# EAGLE design LiPo-BoardV1-2019 (EAGLE 9.2.2)
ERSTELLER: Jakob Holz; PROJEKT: LiPo-Baord; VERSION: 1.0
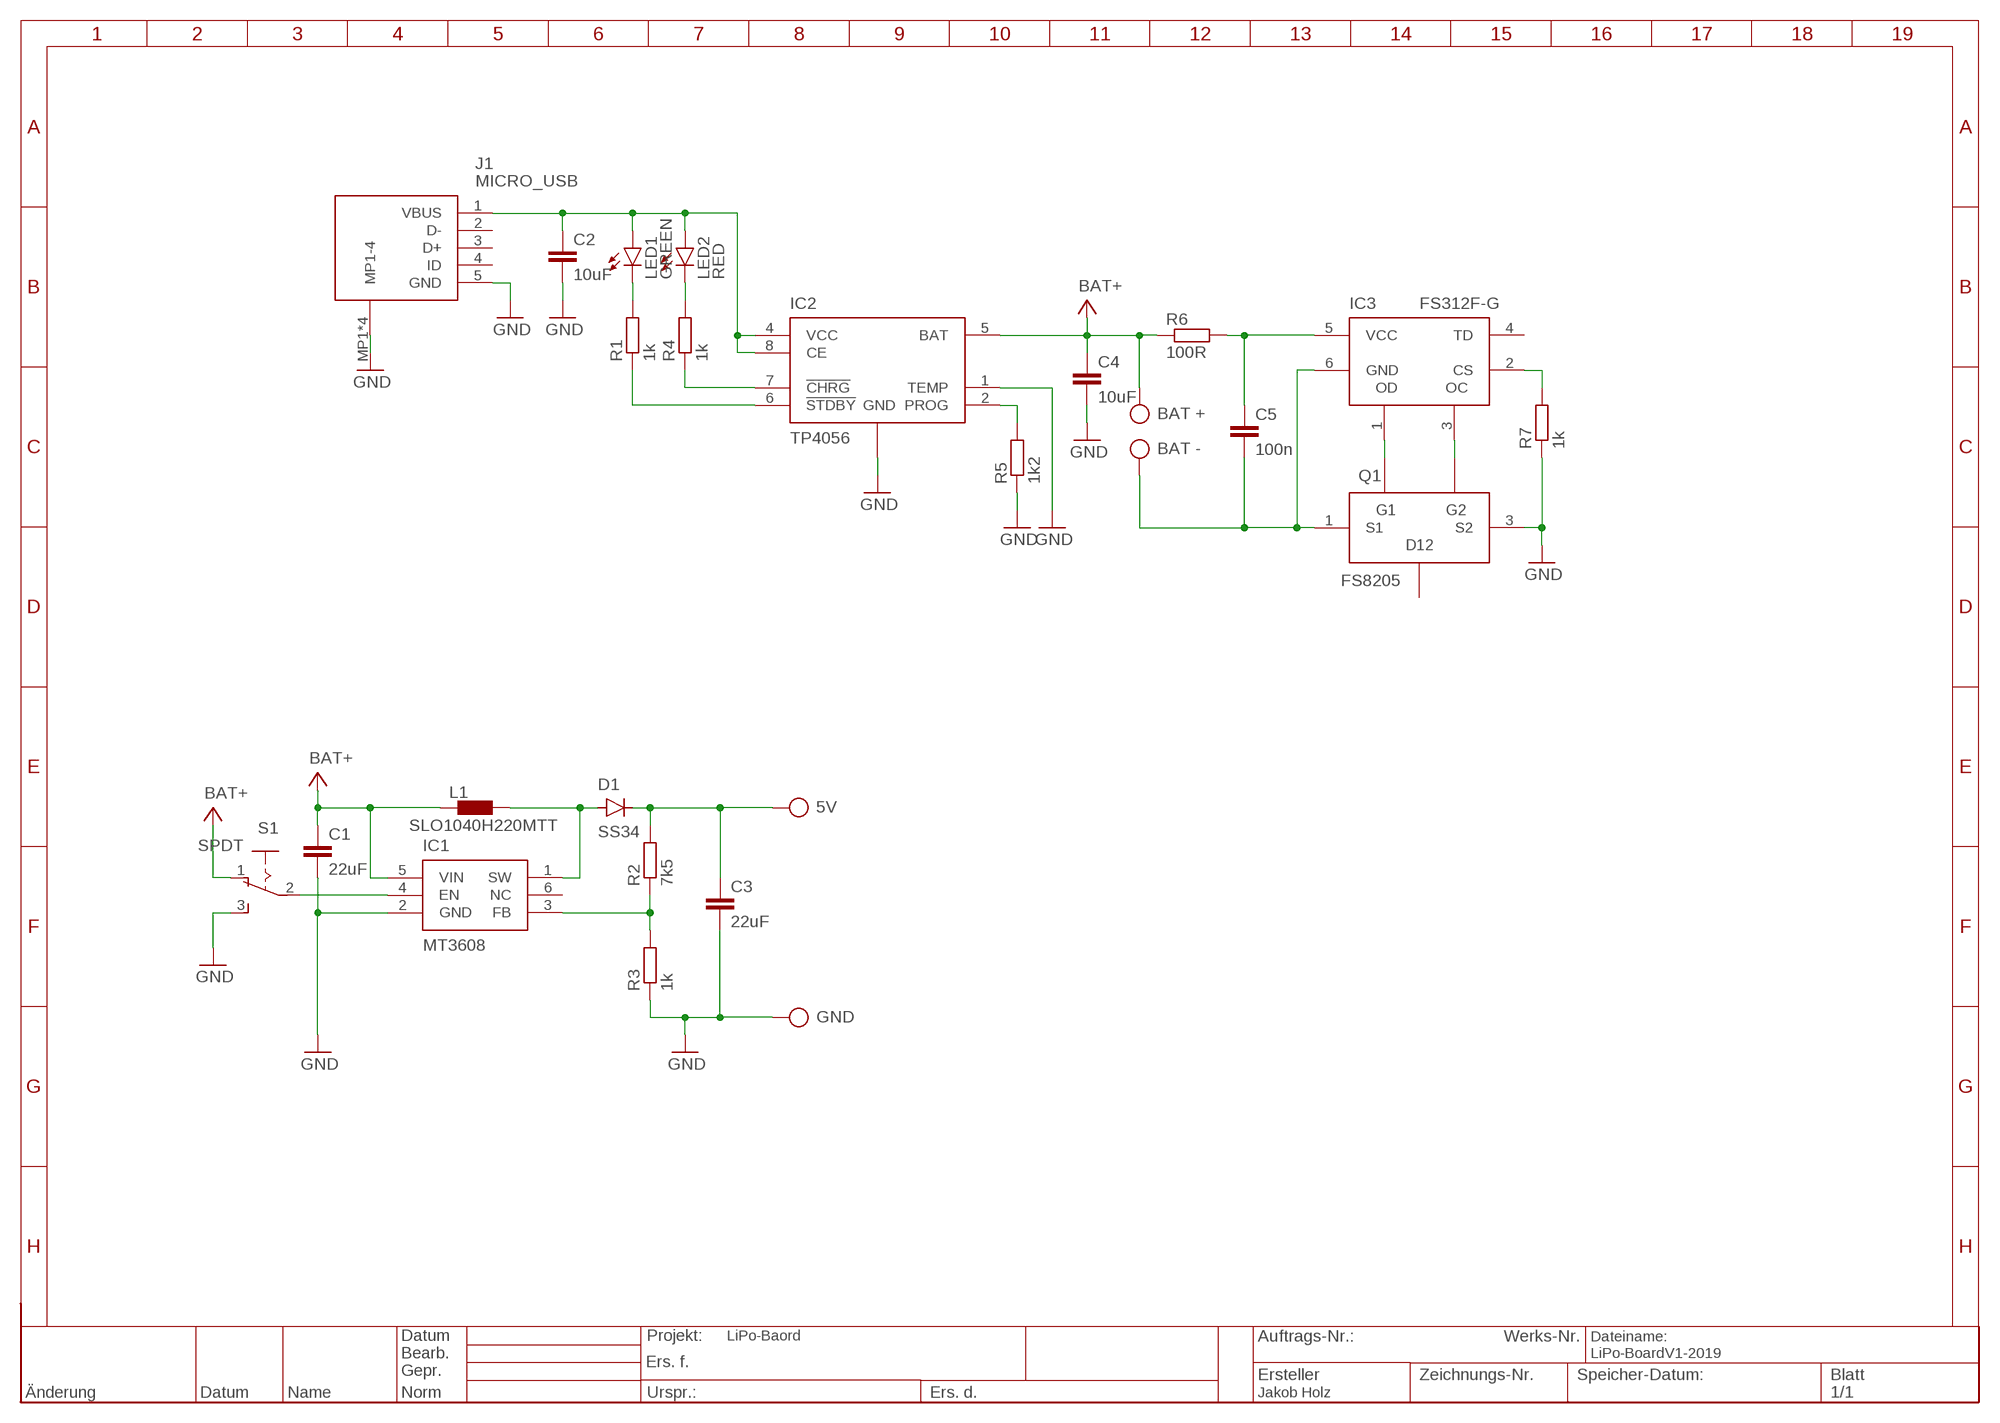
[diagram p0: schematic, sheet 1]

## Parts
C1  22uF  C-EUC1812  [C1812]
C2  10uF  C-EUC0603  [C0603]
C3  22uF  C-EUC1812  [C1812]
C4  10uF  C-EUC0603  [C0603]
C5  100n  C-EUC0603  [C0603]
D1  SS34  DIODE-DO-214AC  [DO-214AC]
IC1  MT3608  [SOT-23-6]
IC2  TP4056  [SOP-8]
IC3  FS312F-G  [SOT-23-6]
J1  MICRO_USB  [MICROUSB]
J2  5V  CON-PAD  [CON-PAD]
J3  GND  CON-PAD  [CON-PAD]
J4  BAT +  CON-PAD  [CON-PAD]
J5  BAT -  CON-PAD  [CON-PAD]
L1  SLO1040H220MTT  [INDUCTOR10.8X10]
LED1  GREEN  LEDCHIPLED_0603  [CHIPLED_0603]
LED2  RED  LEDCHIPLED_0603  [CHIPLED_0603]
Q1  FS8205  [SOT-23-6]
R1  1k  R-EU_R0603  [R0603]
R2  7k5  R-EU_R0603  [R0603]
R3  1k  R-EU_R0603  [R0603]
R4  1k  R-EU_R0603  [R0603]
R5  1k2  R-EU_R0603  [R0603]
R6  100R  R-EU_R0603  [R0603]
R7  1k  R-EU_R0603  [R0603]
S1  SPDT  [SPDT]

## Nets
5V: C3.1 D1.C J2.1 R2.2
BAT+: C1.1 C4.1 IC1.5(VIN) IC2.5(BAT) J4.1 L1.1 R6.1 S1.1
BAT-: C5.2 IC3.6(GND) J5.1 Q1.1(S1)
GND: C1.2 C2.2 C3.2 C4.2 IC1.2(GND) IC2.1(TEMP) IC2.3(GND) IC2.9(GND) J1.5(GND) J1.MP1(MP1-4) J1.MP2(MP1-4) J1.MP3(MP1-4) J1.MP4(MP1-4) J3.1 Q1.3(S2) R3.1 R5.1 R7.1 S1.3
N$1: D1.A IC1.1(SW) L1.2
N$2: LED1.C R1.2
N$3: LED2.C R4.2
N$4: IC2.7(!CHRG) R4.1
N$5: IC2.6(!STDBY) R1.1
N$6: IC1.3(FB) R2.1 R3.2
N$7: IC2.2(PROG) R5.2
N$8: IC1.4(EN) S1.2
N$10: IC3.1(OD) Q1.6(G1)
N$11: IC3.3(OC) Q1.4(G2)
N$12: IC3.2(CS) R7.2
N$13: C5.1 IC3.5(VCC) R6.2
VBUS: C2.1 IC2.4(VCC) IC2.8(CE) J1.1(VBUS) LED1.A LED2.A
Unconnected: IC1.6(NC) IC3.4(TD) J1.2(D-) J1.3(D+) J1.4(ID) Q1.2(D12) Q1.5(D12)

## Library data of the parts
C1 C3 = resistor:C-EU: CAPACITOR, European symbol
C2 C4 C5 = rcl:C-EU: CAPACITOR, European symbol; SPICEPREFIX: C
D1 = diode:DIODE-: DIODE
IC1 = Jakobs_LBR:MT3608: High Efficiency 1.2MHz 2A Step Up Converter Source: Datasheet <https://www.olimex.com/Products/Breadboarding/BB-PWR-3608/resources/MT3608.pdf>; DESCRIPTION: High Efficiency 1.2MHz 2A Step Up Converter; HEIGHT: 1.45mm; MANUFACTURER_NAME: Aerosemi; MANUFACTURER_PART_NUMBER: MT3608
IC2 = Jakobs_LBR:TP4056: 1A Standalone Linear Li-lon Battery Charger, SOP-8 Source: Datasheet <https://dlnmh9ip6v2uc.cloudfront.net/datasheets/Prototyping/TP4056.pdf>; DESCRIPTION: 1A Standalone Linear Li-lon Battery Charger, SOP-8; HEIGHT: 1.75mm; MANUFACTURER_NAME: NanJing Top Power; MANUFACTURER_PART_NUMBER: TP4056
IC3 = Jakobs_LBR:FS312F-G: One Cell Lithium-ion/Polymer Battery Protection IC Source: Datasheet <https://www.ic-fortune.com/upload/Download/FS312F-G-DS-12_EN.pdf>; DESCRIPTION: One Cell Lithium-ion/Polymer Battery Protection IC; HEIGHT: 1.45mm; MANUFACTURER_NAME: Fortune Semiconductor Corporation; MANUFACTURER_PART_NUMBER: FS312F-G
J1 = Jakobs_LBR:MICRO_USB
J2-J5 = Jakobs_LBR:CON-PAD
L1 = Jakobs_LBR:SLO1040H220MTT; DC_CURRENT: 4A; DC_RESISTANCE: 66mΩ; INDUCTANCE: 22uH; SATURATION_CURRENT: 5.5A
LED1 LED2 = led:LED: LED OSRAM: - CHIPLED LG R971, LG N971, LY N971, LG Q971, LY Q971, LO R971, LY R971 LH N974, LH R974 LS Q976, LO Q976, LY Q976 LO Q996 - Hyper CHIPLED LW Q18S LB Q993, LB Q99A, LB R99A - SideLED LS A670, LO A670, LY A670, LG A670, LP A670 LB A673, LV A673, LT A673, LW A673 LH A674 LY A675 LS A676, LA A676, LO A676, LY A676, LW A676 LS A679, LY A679, LG A679 - Hyper Micro SIDELED® LS Y876, LA Y876, LO Y876, LY Y876 LT Y87S - SmartLED LW L88C, LW L88S LB L89C, LB L89S, LG L890 LS L89K, LO L89K, LY L89K LS L896, LA L896, LO L896, LY L896 - TOPLED LS T670, LO T670, LY T670, LG T670, LP T670 LSG T670, LSP T670, LSY T670, LOP T670, LYG T670 LG T671, LOG T671, LSG T671 LB T673, LV T673, LT T673, LW T673 LH T674 LS T676, LA T676, LO T676, LY T676, LB T676, LH T676, LSB T676, LW T676 LB T67C, LV T67C, LT T67C, LS T67K, LO T67K, LY T67K, LW E67C LS E67B, LA E67B, LO E67B, LY E67B, LB E67C, LV E67C, LT E67C LW T67C LS T679, LY T679, LG T679 LS T770, LO T770, LY T770, LG T770, LP T770 LB T773, LV T773, LT T773, LW T773 LH T774 LS E675, LA E675, LY E675, LS T675 LS T776, LA T776, LO T776, LY T776, LB T776 LHGB T686 LT T68C, LB T68C - Hyper Mini TOPLED® LB M676 - Mini TOPLED Santana® LG M470 LS M47K, LO M47K, LY M47K Source: http://www.osram.convergy.de LUXEON: - LUMILED® LXK2-PW12-R00, LXK2-PW12-S00, LXK2-PW14-U00, LXK2-PW14-V00 LXK2-PM12-R00, LXK2-PM12-S00, LXK2-PM14-U00 LXK2-PE12-Q00, LXK2-PE12-R00, LXK2-PE12-S00, LXK2-PE14-T00, LXK2-PE14-U00 LXK2-PB12-K00, LXK2-PB12-L00, LXK2-PB12-M00, LXK2-PB14-N00, LXK2-PB14-P00, LXK2-PB14-Q00 LXK2-PR12-L00, LXK2-PR12-M00, LXK2-PR14-Q00, LXK2-PR14-R00 LXK2-PD12-Q00, LXK2-PD12-R00, LXK2-PD12-S00 LXK2-PH12-R00, LXK2-PH12-S00 LXK2-PL12-P00, LXK2-PL12-Q00, LXK2-PL12-R00 Source: www.luxeon.com KINGBRIGHT: KA-3528ASYC Source: www.kingbright.com
Q1 = Jakobs_LBR:FS8205: DUAL N-CHANNEL ENHANCEMENT MODE POWER MOFSET Source: Datasheet <https://www.ic-fortune.com/upload/Download/FS8205-DS-19_EN.pdf>; DESCRIPTION: DUAL N-CHANNEL ENHANCEMENT MODE POWER MOFSET; HEIGHT: 1mm; MANUFACTURER_NAME: Fortune Semiconductor Corporation; MANUFACTURER_PART_NUMBER: FS8205
R1-R7 = rcl:R-EU_: RESISTOR, European symbol; SPICEPREFIX: R
S1 = Jakobs_LBR:SPDT

## Board
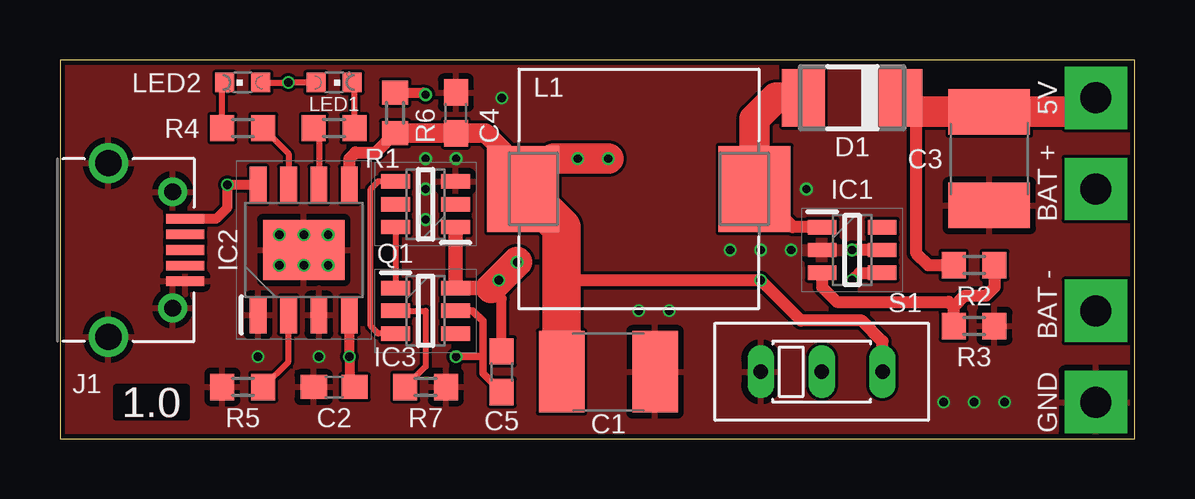
[diagram p1: board, top side]
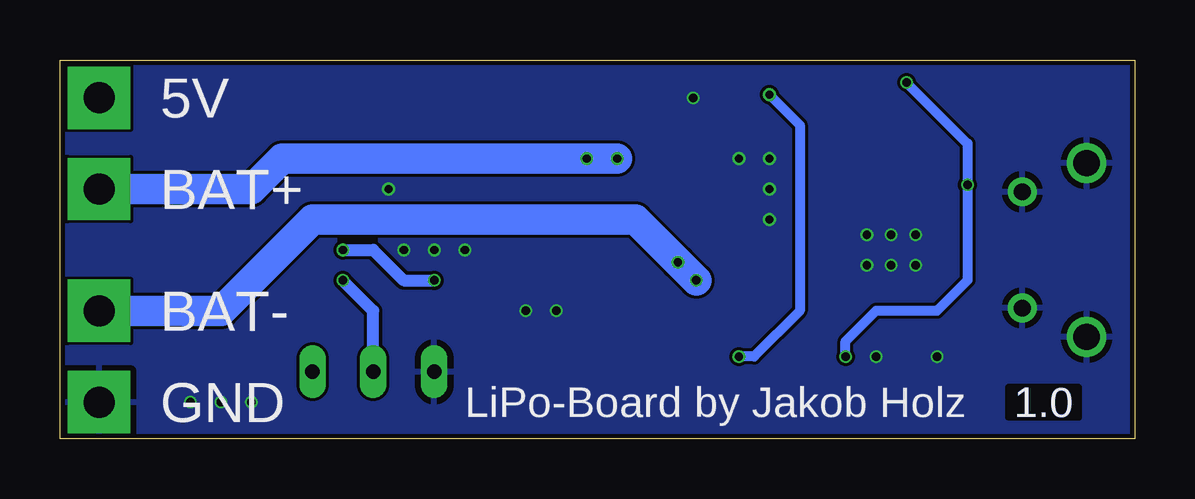
[diagram p2: board, bottom side, seen from below]

Size 44.81 x 15.8 mm. Coordinates in mm from the lower left corner, seen from the top.
Outline: 0,0 44.81,0 44.81,15.8 0,15.8 0,0
Copper layers (1*16): Top 0.035mm / dielectric 1.5mm / Bottom 0.035mm
Design rules "JLC 2Layers": minimum track width 5mil, minimum drill 0.3mm, track to track 5mil, track to pad 5mil, pad to pad 5mil, via to via 5mil, smd to smd 5mil, copper to edge 0.2mm, drill to drill 6mil, minimum pad ring 10mil, minimum via ring 3mil, stop-mask expansion 4mil, vias tented up to drill 0mil, thermal gap 10mil

### Footprints (pad centres in the part's own frame; a part is rotated, then mirrored left to right if it is on the bottom)
C1812 = smd 1.9 x 3.4: 1 -1.95,0; 2 1.95,0
C0603 = smd 1.1 x 1: 1 -0.85,0; 2 0.85,0
DO-214AC = smd 1.8 x 2.4: A 2.025,0; C -2.025,0
SOT-23-6 = smd 1.2 x 0.6: 1 -1.25,0.95; 2 -1.25,0; 3 -1.25,-0.95; 4 1.25,-0.95; 5 1.25,0; 6 1.25,0.95
SOP-8 = smd 1.525 x 0.7: 1 -2.712,1.905; 2 -2.712,0.635; 3 -2.712,-0.635; 4 -2.712,-1.905; 5 2.712,-1.905; 6 2.712,-0.635; 7 2.712,0.635; 8 2.712,1.905 | smd 2.513 x 3.402: 9 0,0
MICROUSB = smd 0.4 x 1.6: 1 1.3,-2.68; 2 0.65,-2.68; 3 0,-2.68; 4 -0.65,-2.68; 5 -1.3,-2.68 | drill 1.1: MP1 -3.625,0.521; MP4 3.625,0.521 | drill 0.7: MP2 -2.425,-2.159; MP3 2.425,-2.159
CON-PAD = drill 1.3 pad 2.6 square: 1 0,0
INDUCTOR10.8X10 = smd 3 x 3.6: 1 -4.826,0; 2 4.826,0
CHIPLED_0603 = smd 0.8 x 0.8: A 0,-0.75; C 0,0.75
R0603 = smd 1 x 1.1: 1 -0.85,0; 2 0.85,0
SPDT = drill 0.6 long: 1 -2.54,0; 2 0,0; 3 2.54,0

### Placement (x,y rotation side)
C1  22.86,2.79 0 top
C2  11.43,2.16 180 top
C3  38.73,11.68 270 top
C4  16.51,13.59 90 top
C5  18.41,2.79 90 top
D1  33.02,14.22 180 top
IC1  33.02,7.87 0 top
IC2  10.16,7.87 90 top
IC3  15.24,5.33 0 top
J1  2.54,7.87 90 top
J2  43.18,14.22 180 top
J3  43.18,1.52 180 top
J4  43.18,10.41 180 top
J5  43.18,5.33 180 top
L1  24.13,10.41 0 top
LED1  11.43,14.86 270 top
LED2  7.62,14.86 90 top
Q1  15.24,9.78 180 top
R1  11.43,12.95 0 top
R2  38.1,7.24 180 top
R3  38.1,4.7 180 top
R4  7.62,12.95 180 top
R5  7.62,2.16 0 top
R6  13.97,13.59 90 top
R7  15.24,2.16 180 top
S1  31.75,2.79 180 top

### Tracks (layer width: path | path; a pad name or v marks a point on that pad's centre or on a via)
5V
  Top 0.508: D1.C 35.69,13.58 35.69,7.75 36.2,7.24 R2.2
  Top 1.27: D1.C 35.63,13.63 C3.1 42.59,13.63 J2.1
BAT+  (via drill 0.35)
  Top 0.508: IC2.5 12.06,11.68 12.32,11.94 13.17,11.94 R6.1 | IC1.5 v33.02,7.87 | 20.91,6.64 20.95,6.6 v29.21,6.6 30.89,4.93 33.43,4.93 34.29,4.06 S1.1
  Top 0.813: R6.1 C4.1 17.74,12.74 19.3,11.17
  Top 1.27: v22.86,11.68 v21.59,11.68 20.57,11.68 L1.1 19.3,11.17
  Top 1.6: C1.1 20.91,6.64 20.91,8.81 L1.1
  Bottom 0.508: v33.02,7.87 31.75,7.87 30.48,6.6 v29.21,6.6
  Bottom 1.27: v21.59,11.68 v22.86,11.68 35.56,11.68 36.83,10.41 J4.1
BAT-  (via drill 0.35)
  Top 0.406: C5.2 18.41,5.84 17.97,6.28
  Top 0.61: Q1.1 IC3.6 17.97,6.28
  Top 1.27: v19.05,7.37 v18.29,6.6 17.97,6.28
  Bottom 1.27: J5.1 38.1,5.33 34.29,9.14 20.83,9.14 v19.05,7.37 v18.29,6.6
GND  (via drill 0.35)
  other vias: 9.14,8.51 10.16,8.51 11.18,8.51 9.14,7.24 10.16,7.24 11.18,7.24 15.24,9.14 15.24,10.41 8.26,3.43 38.1,1.52 36.83,1.52 18.41,14.22 39.37,1.52 31.11,10.41 30.48,7.87 15.24,11.68 16.51,11.68 29.21,7.87 24.13,5.33 25.4,5.33 27.94,7.87 10.79,3.43
  pour Top (rank 2): 0,16.76 45.72,16.76 45.72,-1.02 0,-1.02
  pour Bottom: 0,16.76 45.72,16.76 45.72,-1.02 0,-1.02
  pour Top: 30.48,8.38 32.64,8.38 32.64,7.37 30.48,7.37
  pour Top: 10.16,6.6 11.43,6.6 11.43,5.33 10.16,5.33
  pour Top: 7.62,6.6 8.89,6.6 8.89,5.33 7.62,5.33
N$1
  Top 0.508: IC1.1 30.55,8.82 L1.2
  Top 1.27: L1.2 28.96,13.34 29.84,14.22 D1.A
N$2
  Top 0.254: R1.2 12.28,14.76 LED1.C
N$3
  Top 0.254: R4.2 6.77,14.76 LED2.C
N$4
  Top 0.254: R4.1 9.53,11.9 IC2.7
N$5
  Top 0.254: R1.1 10.79,12.74 IC2.6
N$6
  Top 0.508: R2.1 38.95,6.31 38.61,5.97 37.72,5.97 37.25,5.5 | R3.2 37.25,5.5 | IC1.3 31.77,6.33 32.38,5.71 37.03,5.71 37.25,5.5
N$7
  Top 0.254: R5.2 9.53,3.21 IC2.2
N$8  (via drill 0.35)
  Top 0.508: v33.02,6.6 33.34,6.92 IC1.4
  Bottom 0.508: v33.02,6.6 31.75,5.33 S1.2
N$10
  Top 0.254: Q1.6 IC3.1
N$11
  Top 0.254: Q1.4 13.27,10.73 12.95,10.41 12.95,4.7 13.27,4.38 IC3.3
N$12
  Top 0.254: IC3.2 15.24,5.33 15.24,3.01 R7.2
N$13  (via drill 0.35)
  Top 0.305: IC3.5 17.2,5.33 17.64,4.9 17.64,3.43 | C5.1 17.64,2.72 17.64,3.43 | v16.51,3.43 17.64,3.43
  Top 0.406: R6.2 15.15,14.44 v15.24,14.35
  Bottom 0.406: v15.24,14.35 13.97,13.08 13.97,5.33 15.88,3.43 v16.51,3.43
VBUS  (via drill 0.35)
  Top 0.254: LED1.A v9.53,14.86 LED2.A
  Top 0.406: IC2.8 v6.99,10.59 6.99,9.65 6.51,9.17 J1.1 | IC2.4 v12.06,3.43 12.06,2.37 C2.1
  Bottom 0.406: v12.06,3.43 12.06,4.06 10.79,5.33 8.26,5.33 6.99,6.6 v6.99,10.59 6.99,12.32 v9.53,14.86

### Text on the board
bNames: 5V | BAT+ | BAT- | GND | LiPo-Board by Jakob Holz